# Altium schematic sheet Ethernet.SchDoc
size A3; SheetNumber: 4; SheetTotal: 4
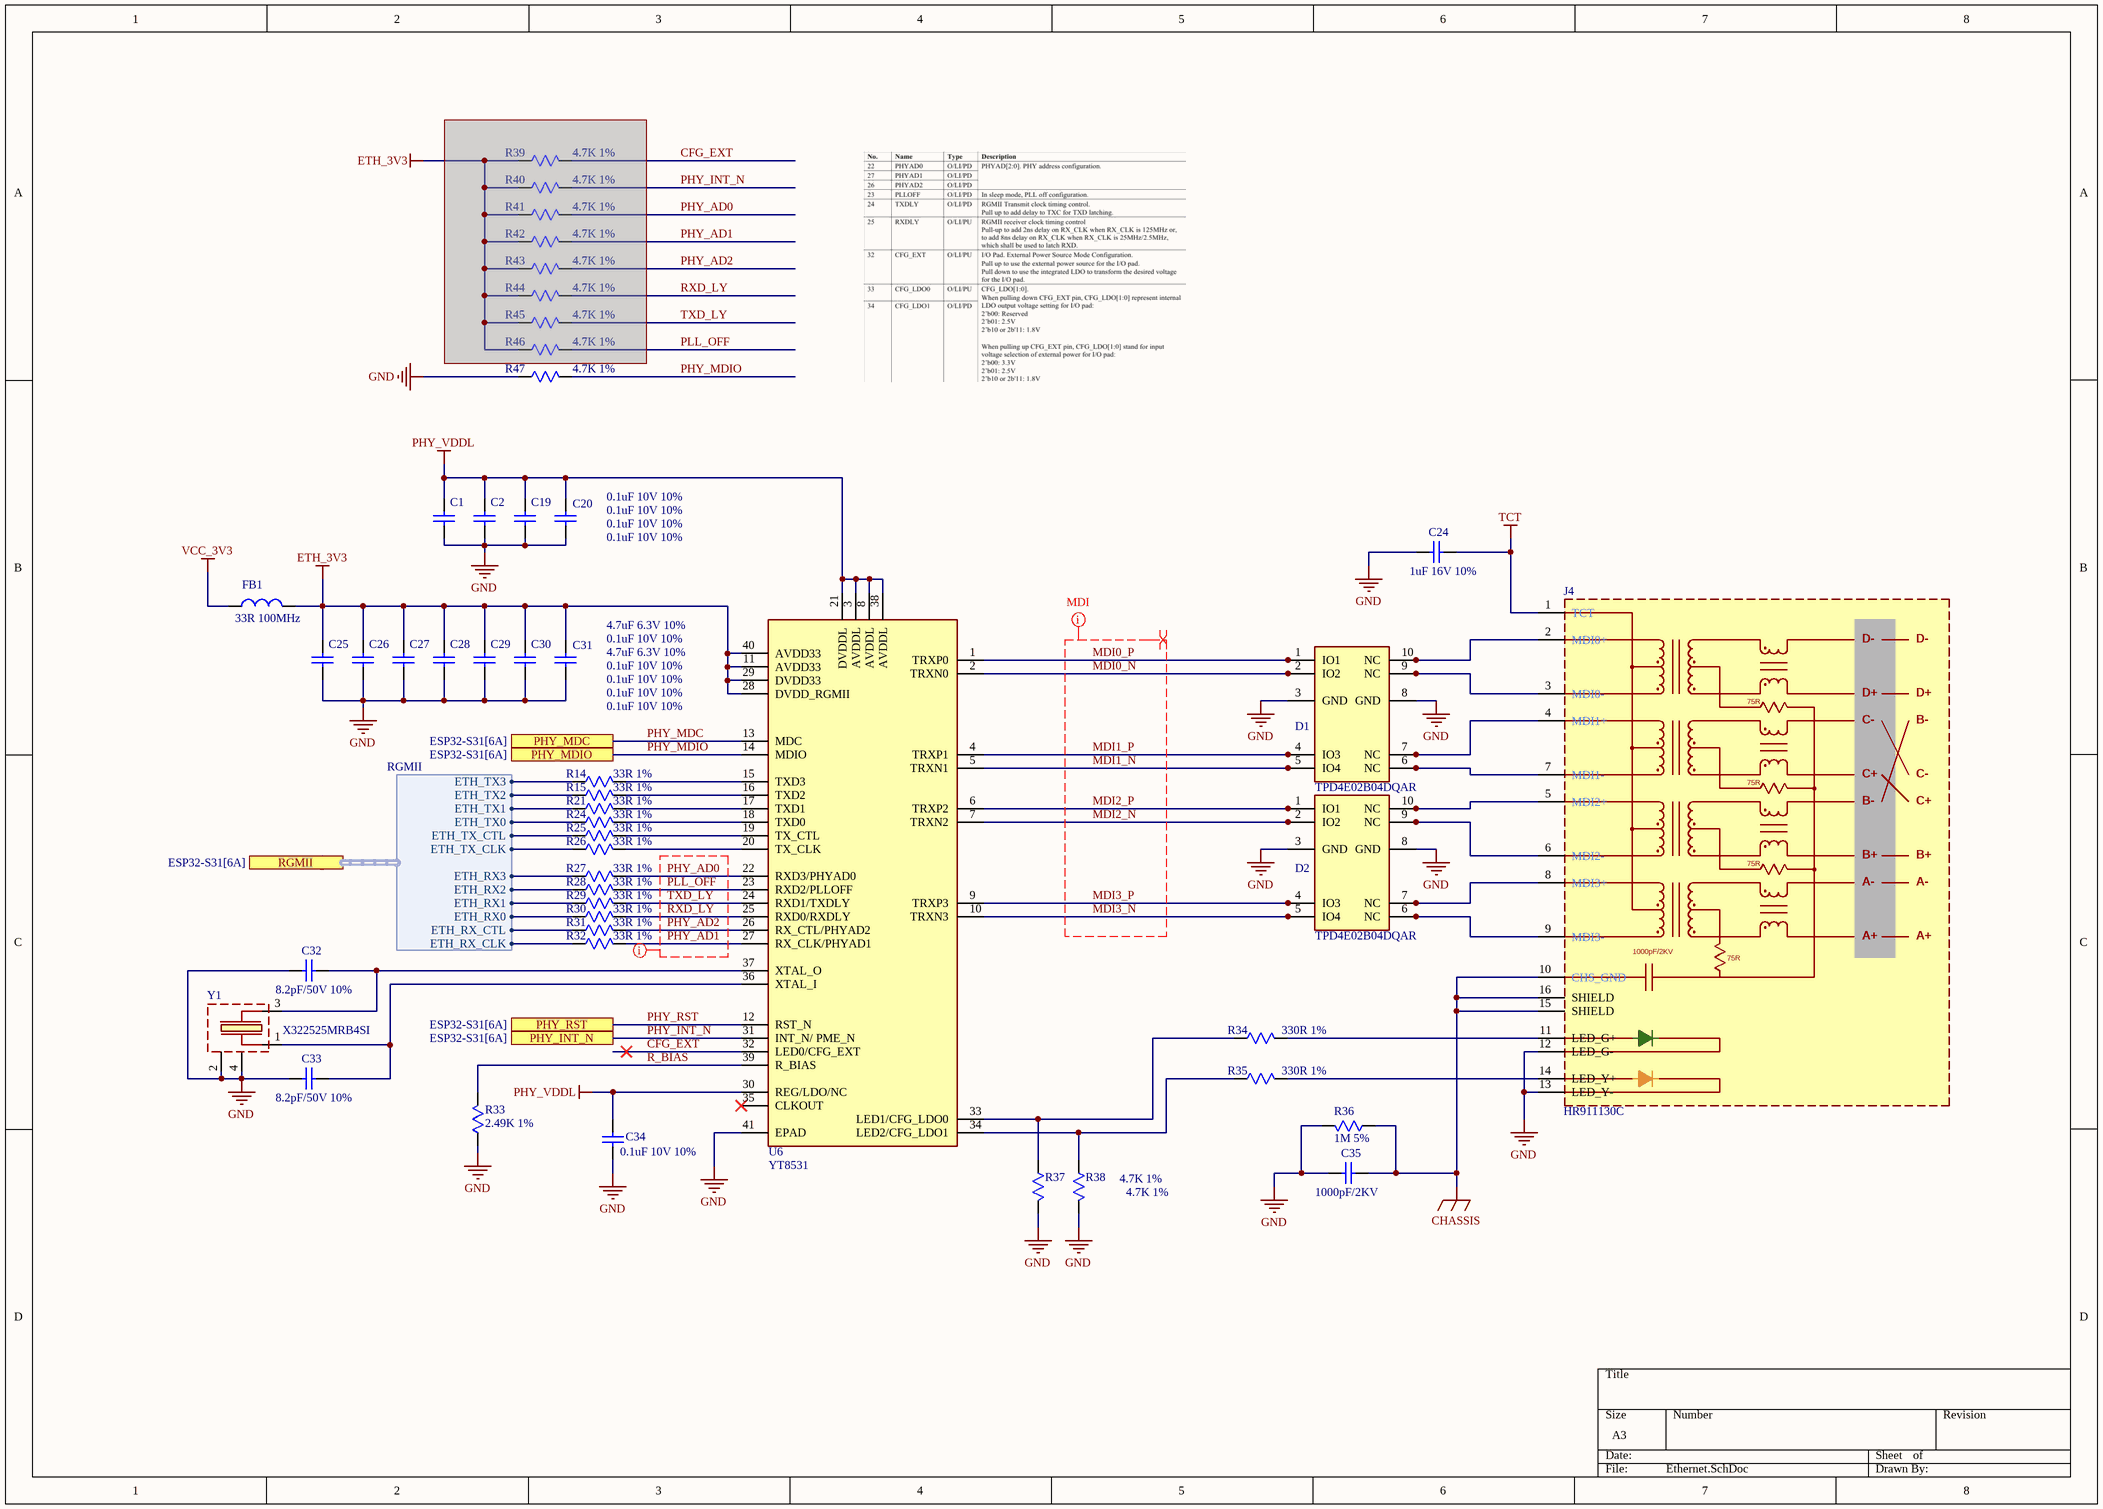
[diagram p0: Ethernet.SchDoc]

## Parts
C1  0.1uF 10V 10%  [C0402]
C2  0.1uF 10V 10%  [C0402]
C19  0.1uF 10V 10%  [C0402]
C20  0.1uF 10V 10%  [C0402]
C24  1uF 16V 10%  [C0603]
C25  4.7uF 6.3V 10%  [C0603]
C26  4.7uF 6.3V 10%  [C0603]
C27  0.1uF 10V 10%  [C0402]
C28  0.1uF 10V 10%  [C0402]
C29  0.1uF 10V 10%  [C0402]
C30  0.1uF 10V 10%  [C0402]
C31  0.1uF 10V 10%  [C0402]
C32  8.2pF/50V 10%  [C0402]
C33  8.2pF/50V 10%  [C0402]
C34  0.1uF 10V 10%  [C0402]
C35  1000pF/2KV  [C1206]
D1  TPD4E02B04DQAR  [USON-10]
D2  TPD4E02B04DQAR  [USON-10]
FB1  33R 100MHz  [L0603]
J4  HR911130C  [HR911130C]
R14  33R 1%  [R0402]
R15  33R 1%  [R0402]
R21  33R 1%  [R0402]
R24  33R 1%  [R0402]
R25  33R 1%  [R0402]
R26  33R 1%  [R0402]
R27  33R 1%  [R0402]
R28  33R 1%  [R0402]
R29  33R 1%  [R0402]
R30  33R 1%  [R0402]
R31  33R 1%  [R0402]
R32  33R 1%  [R0402]
R33  2.49K 1%  [R0402]
R34  330R 1%  [R0402]
R35  330R 1%  [R0402]
R36  1M 5%  [R1206]
R37  4.7K 1%  [R0402]
R38  4.7K 1%  [R0402]
R39  4.7K 1%  [R0402]  (masked out: inside a compile mask, not in the netlist)
R40  4.7K 1%  [R0402]  (masked out: inside a compile mask, not in the netlist)
R41  4.7K 1%  [R0402]  (masked out: inside a compile mask, not in the netlist)
R42  4.7K 1%  [R0402]  (masked out: inside a compile mask, not in the netlist)
R43  4.7K 1%  [R0402]  (masked out: inside a compile mask, not in the netlist)
R44  4.7K 1%  [R0402]  (masked out: inside a compile mask, not in the netlist)
R45  4.7K 1%  [R0402]  (masked out: inside a compile mask, not in the netlist)
R46  4.7K 1%  [R0402]  (masked out: inside a compile mask, not in the netlist)
R47  4.7K 1%  [R0402]
U6  YT8531  [QFN-40]
Y1  X322525MRB4SI  [XTAL 4P 3225]

## Ports
PHY_INT_N (see ESP32-S31[6A]), PHY_MDC (see ESP32-S31[6A]), PHY_MDIO (see ESP32-S31[6A]), PHY_RST (see ESP32-S31[6A]), RGMII (harness RGMII, see ESP32-S31[6A])

## Harnesses
RGMII: ETH_TX1, ETH_TX0, ETH_TX_CTL, ETH_TX_CLK, ETH_RX0, ETH_RX_CTL, ETH_RX_CLK, ETH_TX2, ETH_TX3, ETH_RX1, ETH_RX2, ETH_RX3

## Nets
CHASSIS: C35.2 J4.10(CHS_GND) J4.15(SHIELD) J4.16(SHIELD) R36.1
ETH_3V3: C25.2 C26.2 C27.2 C28.2 C29.2 C30.2 C31.2 FB1.2 U6.11(AVDD33) U6.28(DVDD_RGMII) U6.29(DVDD33) U6.40(AVDD33)
GND: C1.1 C2.1 C19.1 C20.1 C24.2 C25.1 C26.1 C27.1 C28.1 C29.1 C30.1 C31.1 C32.1 C33.1 C34.1 C35.1 D1.3(GND) D1.8(GND) D2.3(GND) D2.8(GND) J4.12(LED_G-) J4.13(LED_Y-) R33.1 R36.2 R37.2 R38.2 R47.1 U6.41(EPAD) Y1.2(GND) Y1.4(GND)
PHY_VDDL: C1.2 C2.2 C19.2 C20.2 C34.2 U6.3(AVDDL) U6.8(AVDDL) U6.21(DVDDL) U6.30(REG/LDO/NC) U6.38(AVDDL)
TCT: C24.1 J4.1(TCT)
VCC_3V3: FB1.1
CFG_EXT: U6.32(LED0/CFG_EXT)
MDI0_N: D1.2(IO2) D1.9(NC) J4.3(MDI0-) U6.2(TRXN0)
MDI0_P: D1.1(IO1) D1.10(NC) J4.2(MDI0+) U6.1(TRXP0)
MDI1_N: D1.5(IO4) D1.6(NC) J4.7(MDI1-) U6.5(TRXN1)
MDI1_P: D1.4(IO3) D1.7(NC) J4.4(MDI1+) U6.4(TRXP1)
MDI2_N: D2.2(IO2) D2.9(NC) J4.6(MDI2-) U6.7(TRXN2)
MDI2_P: D2.1(IO1) D2.10(NC) J4.5(MDI2+) U6.6(TRXP2)
MDI3_N: D2.5(IO4) D2.6(NC) J4.9(MDI3-) U6.10(TRXN3)
MDI3_P: D2.4(IO3) D2.7(NC) J4.8(MDI3+) U6.9(TRXP3)
PHY_AD0: R27.2 U6.22(RXD3/PHYAD0)
PHY_AD1: R32.2 U6.27(RX_CLK/PHYAD1)
PHY_AD2: R31.2 U6.26(RX_CTL/PHYAD2)
PHY_INT_N: U6.31(INT_N/_PME_N) ; port PHY_INT_N
PHY_MDC: U6.13(MDC) ; port PHY_MDC
PHY_MDIO: R47.2 U6.14(MDIO) ; port PHY_MDIO
PHY_RST: U6.12(RST_N) ; port PHY_RST
PLL_OFF: R28.2 U6.23(RXD2/PLLOFF)
R_BIAS: R33.2 U6.39(R_BIAS)
RXD_LY: R30.2 U6.25(RXD0/RXDLY)
TXD_LY: R29.2 U6.24(RXD1/TXDLY)
NetC32_2: C32.2 U6.37(XTAL_O) Y1.3
NetC33_2: C33.2 U6.36(XTAL_I) Y1.1
NetJ4_11: J4.11(LED_G+) R34.2
NetJ4_14: J4.14(LED_Y+) R35.2
NetR14_1: R14.1 ; port RGMII.ETH_TX3
NetR14_2: R14.2 U6.15(TXD3)
NetR15_1: R15.1 ; port RGMII.ETH_TX2
NetR15_2: R15.2 U6.16(TXD2)
NetR21_1: R21.1 ; port RGMII.ETH_TX1
NetR21_2: R21.2 U6.17(TXD1)
NetR24_1: R24.1 ; port RGMII.ETH_TX0
NetR24_2: R24.2 U6.18(TXD0)
NetR25_1: R25.1 ; port RGMII.ETH_TX_CTL
NetR25_2: R25.2 U6.19(TX_CTL)
NetR26_1: R26.1 ; port RGMII.ETH_TX_CLK
NetR26_2: R26.2 U6.20(TX_CLK)
NetR27_1: R27.1 ; port RGMII.ETH_RX3
NetR28_1: R28.1 ; port RGMII.ETH_RX2
NetR29_1: R29.1 ; port RGMII.ETH_RX1
NetR30_1: R30.1 ; port RGMII.ETH_RX0
NetR31_1: R31.1 ; port RGMII.ETH_RX_CTL
NetR32_1: R32.1 ; port RGMII.ETH_RX_CLK
NetR34_1: R34.1 R37.1 U6.33(LED1/CFG_LDO0)
NetR35_1: R35.1 R38.1 U6.34(LED2/CFG_LDO1)

Not connected (* = marked no-connect by the designer): U6 35(CLKOUT)*

## Layout directives
differential pair; differential pair class MDI_class: MDI0_N, MDI0_P, MDI1_N, MDI1_P, MDI2_N, MDI2_P, MDI3_N, MDI3_P
net class MDI: MDI0_N, MDI0_P, MDI1_N, MDI1_P, MDI2_N, MDI2_P, MDI3_N, MDI3_P
net class RGMII: (no net found under the mark), PHY_AD0, PHY_AD1, PHY_AD2, PLL_OFF, RXD_LY, TXD_LY

## Notes on the sheet
- (in symbol HR911130C) D-; D+; 75R; C-; B-; C+; B+; A-; A+; 1000pF/2KV

## Library data of the parts
C1 C2 C19 C20 C25-C35 = Capacitor_Ceramic
C24 = Capacitor_Ceramic: C60474
D1 D2 = Diode ESD array: 4-channel ESD protection diode for USB Type-C and HDMI 2.0 10-USON -40 to 125; MF: Texas Instruments; Value: *; MP: TPD4E02B04DQAR; Package: USON-10 Texas Instruments; Purchase-URL: https://pricing.snapeda.com/search/part/TPD4E02B04DQAR/?ref=eda; SnapEDA_Link: https://www.snapeda.com/parts/TPD4E02B04DQAR/Texas%20Instruments/view-part/576424/?ref=snap; Check_prices: https://www.snapeda.com/parts/TPD4E02B04DQAR/Texas%20Instruments/view-part/576424/?ref=eda; Digi-Key_Part_Number: 296-43875-1-ND
FB1 = Ferrite-bead: BLM18PG330SN1D
J4 = HR911130C: SINGLE PORT RJ45 CONNECTOR WITH INTEGRATED MAGNETICS AND LED; Manufacturer_Name: Hanrun Electronics; Geometry.Height: 15mm; Manufacturer_Part_Number: HR911130C; Mouser Part Number: *; Mouser Price/Stock: *; Arrow Part Number: *; Arrow Price/Stock: *; Datasheet Link: http://www.cecb2b.com/batchupload/inventoryother/zfa_ic_inventory/2011121/zfa__204559_a7c3c0b2f5d8a53eec456bb4b34ade89.PDF
R14 R15 R21 R24-R47 = Resistor
U6 = YT8531: INTEGRATED 10/100/1000 GIGABIT ETHERNET TRANSCEIVER; MF: Texas Instruments; MP: TLK1221RHATG4; SnapEDA_Link: https://www.snapeda.com/parts/TLK1221RHATG4/Texas+Instruments/view-part/?ref=snap; Package: VQFN-40 Texas Instruments; Value: *; Check_prices: https://www.snapeda.com/parts/TLK1221RHATG4/Texas+Instruments/view-part/?ref=eda
Y1 = Crystal 4 Pin: 25 MHz ±10ppm Crystal 18pF 40 Ohms 4-SMD, No Lead; MP: TSX-3225 25.0000MF10P-C0; MF: EPSON; Purchase-URL: https://pricing.snapeda.com/search/part/TSX-3225 25.0000MF10P-C0/?ref=eda; Package: SMD-4 EPSON; Value: *; Availability: In Stock; Price: None; SnapEDA_Link: https://www.snapeda.com/parts/TSX-3225%2025.0000MF10P-C0/EPSON/view-part/?ref=snap; Check_prices: https://www.snapeda.com/parts/TSX-3225%2025.0000MF10P-C0/EPSON/view-part/?ref=eda